# Altium schematic sheet Root.SchDoc: STM32F4 Berkware Development Board
size A4; DrawnBy: Emin Berk Ünal; Revision: 1; SheetNumber: 1; SheetTotal: 5
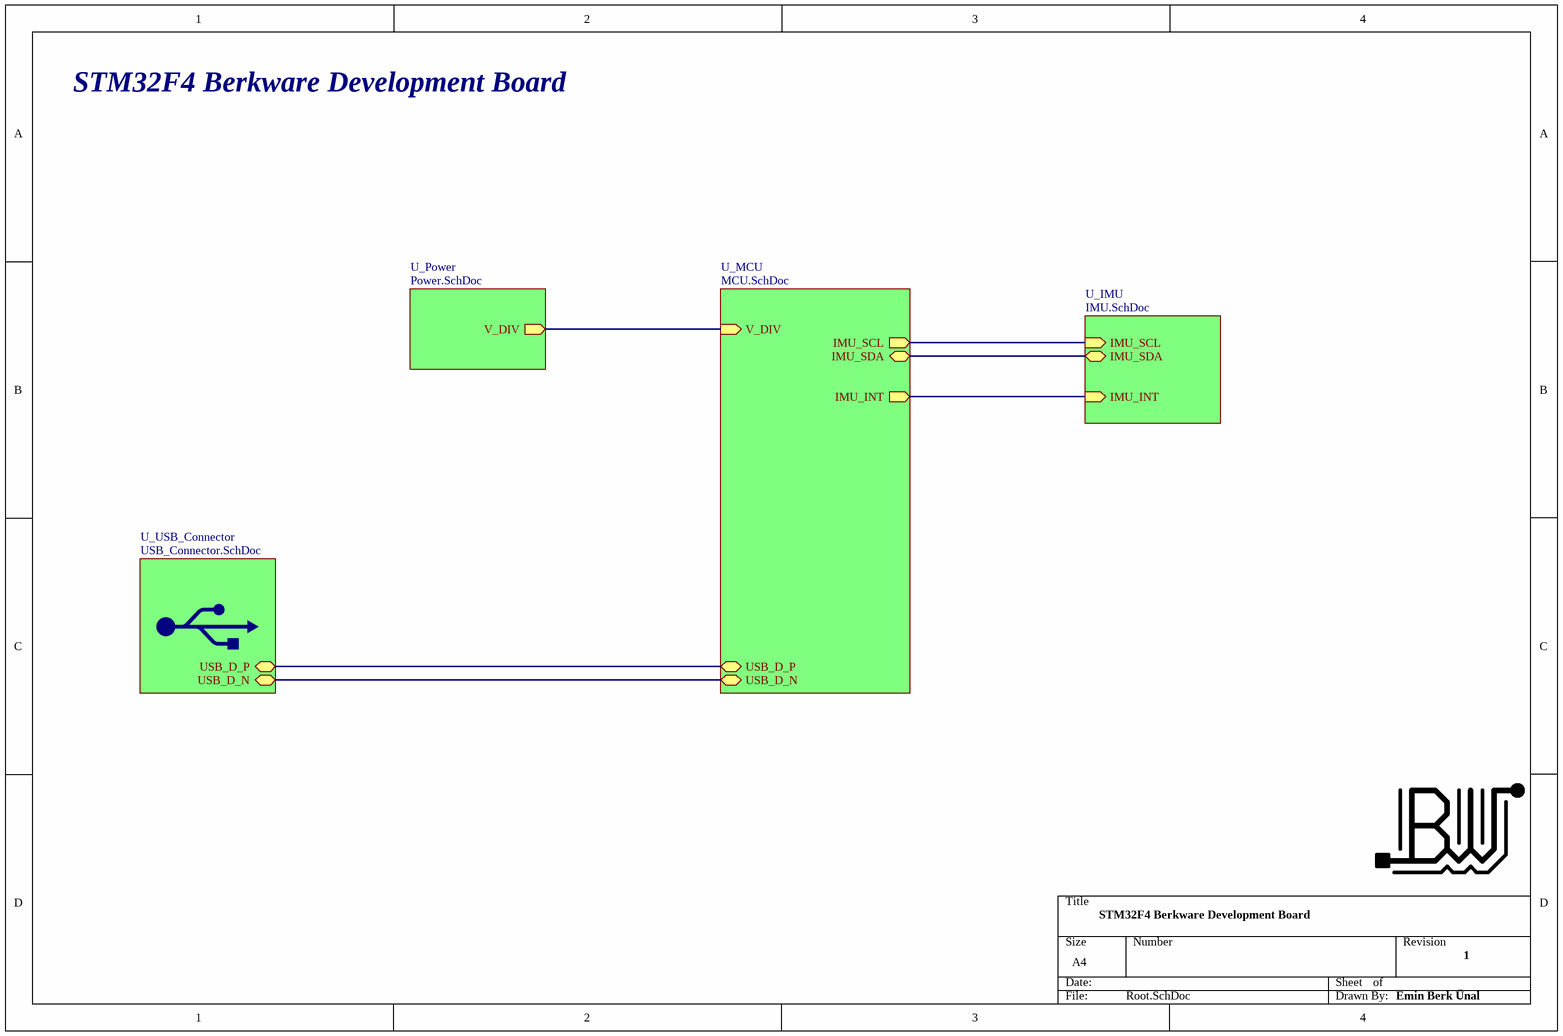
[diagram p0: Root.SchDoc]

## Sub-sheets
U_IMU = IMU.SchDoc: IMU_SCL (in), IMU_SDA (bidir), IMU_INT (in)
U_MCU = MCU.SchDoc: USB_D_P (bidir), USB_D_N (bidir), IMU_SCL (out), IMU_SDA (bidir), IMU_INT (out), V_DIV (in)
U_Power = Power.SchDoc: V_DIV (out)
U_USB_Connector = USB_Connector.SchDoc: USB_D_N (bidir), USB_D_P (bidir)

## Nets
(unnamed): sheet U_MCU/USB_D_P, sheet U_USB_Connector/USB_D_P
(unnamed): sheet U_MCU/USB_D_N, sheet U_USB_Connector/USB_D_N
(unnamed): sheet U_MCU/IMU_SCL, sheet U_IMU/IMU_SCL
(unnamed): sheet U_MCU/IMU_SDA, sheet U_IMU/IMU_SDA
(unnamed): sheet U_MCU/IMU_INT, sheet U_IMU/IMU_INT
(unnamed): sheet U_MCU/V_DIV, sheet U_Power/V_DIV

## Notes on the sheet
- STM32F4 Berkware Development Board